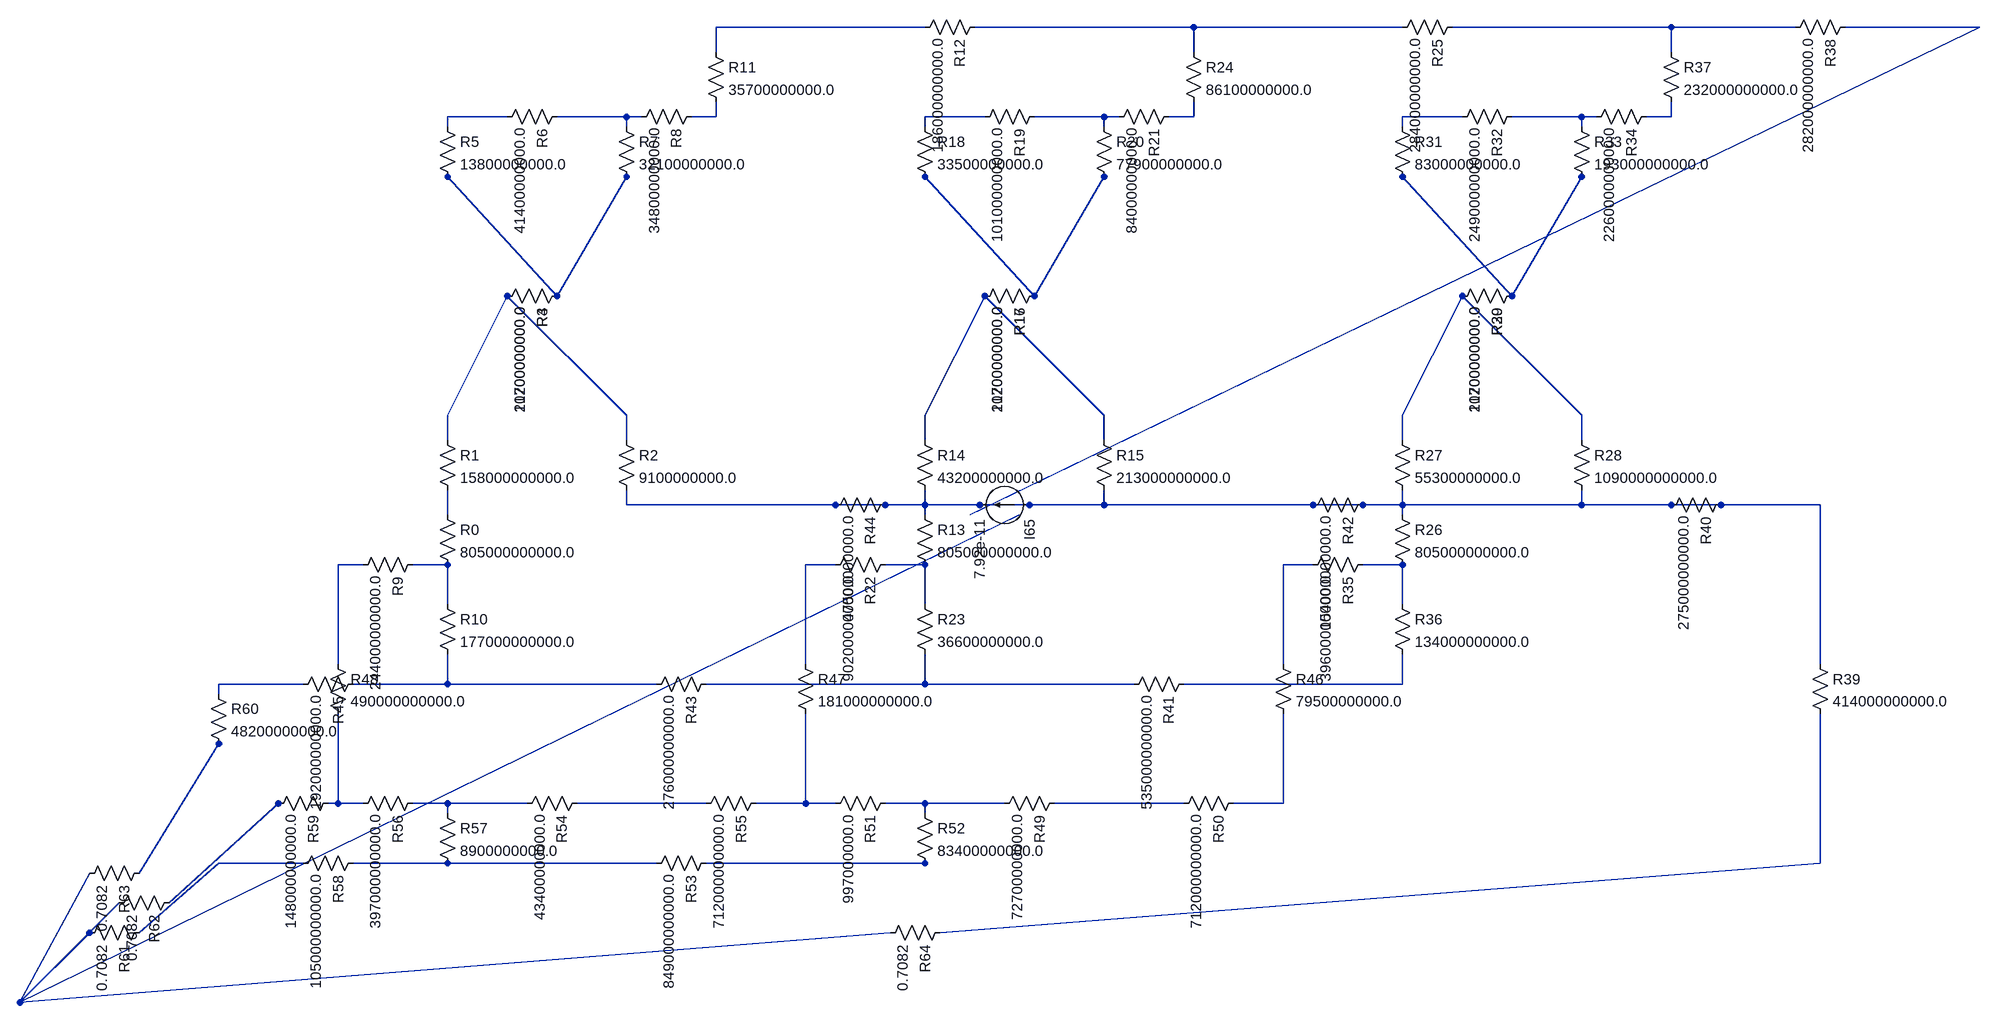
[diagram p0: schematic SPICE_layout.asc]
SPICE_layout.asc, the LTspice schematic file:
Version 4
SHEET 1 880 680
WIRE 688 -704 688 -704
WIRE 688 -784 688 -800
SYMBOL res 672 -800 R0
SYMATTR InstName R0
SYMATTR Value 805000000000.0
WIRE 688 -800 688 -824
WIRE 688 -904 688 -944
SYMBOL res 672 -920 R0
SYMATTR InstName R1
SYMATTR Value 158000000000.0
WIRE 976 -800 976 -824
WIRE 976 -904 976 -944
SYMBOL res 960 -920 R0
SYMATTR InstName R2
SYMATTR Value 9100000000.0
WIRE 688 -944 784 -1136
WIRE 864 -1136 976 -1328
SYMBOL res 880 -1152 R90
SYMATTR InstName R3
SYMATTR Value 11700000000.0
WIRE 976 -944 784 -1136
WIRE 864 -1136 688 -1328
SYMBOL res 880 -1152 R90
SYMATTR InstName R4
SYMATTR Value 20200000000.0
WIRE 688 -1328 688 -1328
WIRE 688 -1408 688 -1424
SYMBOL res 672 -1424 R0
SYMATTR InstName R5
SYMATTR Value 13800000000.0
WIRE 688 -1424 784 -1424
WIRE 864 -1424 976 -1424
SYMBOL res 880 -1440 R90
SYMATTR InstName R6
SYMATTR Value 41400000000.0
WIRE 976 -1328 976 -1328
WIRE 976 -1408 976 -1424
SYMBOL res 960 -1424 R0
SYMATTR InstName R7
SYMATTR Value 32100000000.0
WIRE 976 -1424 1000 -1424
WIRE 1080 -1424 1120 -1424
SYMBOL res 1096 -1440 R90
SYMATTR InstName R8
SYMATTR Value 34800000000.0
WIRE 512 -704 552 -704
WIRE 632 -704 688 -704
SYMBOL res 648 -720 R90
SYMATTR InstName R9
SYMATTR Value 244000000000.0
WIRE 688 -512 688 -560
WIRE 688 -640 688 -704
SYMBOL res 672 -656 R0
SYMATTR InstName R10
SYMATTR Value 177000000000.0
WIRE 1120 -1424 1120 -1448
WIRE 1120 -1528 1120 -1568
SYMBOL res 1104 -1544 R0
SYMATTR InstName R11
SYMATTR Value 35700000000.0
WIRE 1120 -1568 1456 -1568
WIRE 1536 -1568 1888 -1568
SYMBOL res 1552 -1584 R90
SYMATTR InstName R12
SYMATTR Value 186000000000.0
WIRE 1456 -704 1456 -704
WIRE 1456 -784 1456 -800
SYMBOL res 1440 -800 R0
SYMATTR InstName R13
SYMATTR Value 805000000000.0
WIRE 1456 -800 1456 -824
WIRE 1456 -904 1456 -944
SYMBOL res 1440 -920 R0
SYMATTR InstName R14
SYMATTR Value 43200000000.0
WIRE 1744 -800 1744 -824
WIRE 1744 -904 1744 -944
SYMBOL res 1728 -920 R0
SYMATTR InstName R15
SYMATTR Value 213000000000.0
WIRE 1456 -944 1552 -1136
WIRE 1632 -1136 1744 -1328
SYMBOL res 1648 -1152 R90
SYMATTR InstName R16
SYMATTR Value 11700000000.0
WIRE 1744 -944 1552 -1136
WIRE 1632 -1136 1456 -1328
SYMBOL res 1648 -1152 R90
SYMATTR InstName R17
SYMATTR Value 20200000000.0
WIRE 1456 -1328 1456 -1328
WIRE 1456 -1408 1456 -1424
SYMBOL res 1440 -1424 R0
SYMATTR InstName R18
SYMATTR Value 33500000000.0
WIRE 1456 -1424 1552 -1424
WIRE 1632 -1424 1744 -1424
SYMBOL res 1648 -1440 R90
SYMATTR InstName R19
SYMATTR Value 101000000000.0
WIRE 1744 -1328 1744 -1328
WIRE 1744 -1408 1744 -1424
SYMBOL res 1728 -1424 R0
SYMATTR InstName R20
SYMATTR Value 77900000000.0
WIRE 1744 -1424 1768 -1424
WIRE 1848 -1424 1888 -1424
SYMBOL res 1864 -1440 R90
SYMATTR InstName R21
SYMATTR Value 84000000000.0
WIRE 1264 -704 1312 -704
WIRE 1392 -704 1456 -704
SYMBOL res 1408 -720 R90
SYMATTR InstName R22
SYMATTR Value 90200000000.0
WIRE 1456 -512 1456 -560
WIRE 1456 -640 1456 -704
SYMBOL res 1440 -656 R0
SYMATTR InstName R23
SYMATTR Value 36600000000.0
WIRE 1888 -1424 1888 -1448
WIRE 1888 -1528 1888 -1568
SYMBOL res 1872 -1544 R0
SYMATTR InstName R24
SYMATTR Value 86100000000.0
WIRE 1888 -1568 2224 -1568
WIRE 2304 -1568 2656 -1568
SYMBOL res 2320 -1584 R90
SYMATTR InstName R25
SYMATTR Value 284000000000.0
WIRE 2224 -704 2224 -704
WIRE 2224 -784 2224 -800
SYMBOL res 2208 -800 R0
SYMATTR InstName R26
SYMATTR Value 805000000000.0
WIRE 2224 -800 2224 -824
WIRE 2224 -904 2224 -944
SYMBOL res 2208 -920 R0
SYMATTR InstName R27
SYMATTR Value 55300000000.0
WIRE 2512 -800 2512 -824
WIRE 2512 -904 2512 -944
SYMBOL res 2496 -920 R0
SYMATTR InstName R28
SYMATTR Value 1090000000000.0
WIRE 2224 -944 2320 -1136
WIRE 2400 -1136 2512 -1328
SYMBOL res 2416 -1152 R90
SYMATTR InstName R29
SYMATTR Value 11700000000.0
WIRE 2512 -944 2320 -1136
WIRE 2400 -1136 2224 -1328
SYMBOL res 2416 -1152 R90
SYMATTR InstName R30
SYMATTR Value 20200000000.0
WIRE 2224 -1328 2224 -1328
WIRE 2224 -1408 2224 -1424
SYMBOL res 2208 -1424 R0
SYMATTR InstName R31
SYMATTR Value 83000000000.0
WIRE 2224 -1424 2320 -1424
WIRE 2400 -1424 2512 -1424
SYMBOL res 2416 -1440 R90
SYMATTR InstName R32
SYMATTR Value 249000000000.0
WIRE 2512 -1328 2512 -1328
WIRE 2512 -1408 2512 -1424
SYMBOL res 2496 -1424 R0
SYMATTR InstName R33
SYMATTR Value 193000000000.0
WIRE 2512 -1424 2536 -1424
WIRE 2616 -1424 2656 -1424
SYMBOL res 2632 -1440 R90
SYMATTR InstName R34
SYMATTR Value 226000000000.0
WIRE 2032 -704 2080 -704
WIRE 2160 -704 2224 -704
SYMBOL res 2176 -720 R90
SYMATTR InstName R35
SYMATTR Value 39600000000.0
WIRE 2224 -512 2224 -560
WIRE 2224 -640 2224 -704
SYMBOL res 2208 -656 R0
SYMATTR InstName R36
SYMATTR Value 134000000000.0
WIRE 2656 -1424 2656 -1448
WIRE 2656 -1528 2656 -1568
SYMBOL res 2640 -1544 R0
SYMATTR InstName R37
SYMATTR Value 232000000000.0
WIRE 2656 -1568 2856 -1568
WIRE 2936 -1568 3152 -1568
SYMBOL res 2952 -1584 R90
SYMATTR InstName R38
SYMATTR Value 282000000000.0
WIRE 2896 -224 2896 -464
WIRE 2896 -544 2896 -800
SYMBOL res 2880 -560 R0
SYMATTR InstName R39
SYMATTR Value 414000000000.0
WIRE 2896 -800 2656 -800
WIRE 2736 -800 2512 -800
SYMBOL res 2752 -816 R90
SYMATTR InstName R40
SYMATTR Value 275000000000.0
WIRE 1456 -512 1792 -512
WIRE 1872 -512 2224 -512
SYMBOL res 1888 -528 R90
SYMATTR InstName R41
SYMATTR Value 535000000000.0
WIRE 2512 -800 2080 -800
WIRE 2160 -800 1744 -800
SYMBOL res 2176 -816 R90
SYMATTR InstName R42
SYMATTR Value 154000000000.0
WIRE 688 -512 1024 -512
WIRE 1104 -512 1456 -512
SYMBOL res 1120 -528 R90
SYMATTR InstName R43
SYMATTR Value 276000000000.0
WIRE 1744 -800 1312 -800
WIRE 1392 -800 976 -800
SYMBOL res 1408 -816 R90
SYMATTR InstName R44
SYMATTR Value 47500000000.0
WIRE 320 -512 456 -512
WIRE 536 -512 688 -512
SYMBOL res 552 -528 R90
SYMATTR InstName R45
SYMATTR Value 192000000000.0
WIRE 2032 -320 2032 -464
WIRE 2032 -544 2032 -704
SYMBOL res 2016 -560 R0
SYMATTR InstName R46
SYMATTR Value 79500000000.0
WIRE 1264 -320 1264 -464
WIRE 1264 -544 1264 -704
SYMBOL res 1248 -560 R0
SYMATTR InstName R47
SYMATTR Value 181000000000.0
WIRE 512 -320 512 -464
WIRE 512 -544 512 -704
SYMBOL res 496 -560 R0
SYMATTR InstName R48
SYMATTR Value 490000000000.0
WIRE 1456 -320 1584 -320
WIRE 1664 -320 1808 -320
SYMBOL res 1680 -336 R90
SYMATTR InstName R49
SYMATTR Value 72700000000.0
WIRE 1808 -320 1872 -320
WIRE 1952 -320 2032 -320
SYMBOL res 1968 -336 R90
SYMATTR InstName R50
SYMATTR Value 712000000000.0
WIRE 1264 -320 1312 -320
WIRE 1392 -320 1456 -320
SYMBOL res 1408 -336 R90
SYMATTR InstName R51
SYMATTR Value 997000000.0
WIRE 1456 -224 1456 -224
WIRE 1456 -304 1456 -320
SYMBOL res 1440 -320 R0
SYMATTR InstName R52
SYMATTR Value 83400000000.0
WIRE 688 -224 1024 -224
WIRE 1104 -224 1456 -224
SYMBOL res 1120 -240 R90
SYMATTR InstName R53
SYMATTR Value 849000000000.0
WIRE 688 -320 816 -320
WIRE 896 -320 1040 -320
SYMBOL res 912 -336 R90
SYMATTR InstName R54
SYMATTR Value 43400000000.0
WIRE 1040 -320 1104 -320
WIRE 1184 -320 1264 -320
SYMBOL res 1200 -336 R90
SYMATTR InstName R55
SYMATTR Value 712000000000.0
WIRE 512 -320 552 -320
WIRE 632 -320 688 -320
SYMBOL res 648 -336 R90
SYMATTR InstName R56
SYMATTR Value 397000000000.0
WIRE 688 -224 688 -224
WIRE 688 -304 688 -320
SYMBOL res 672 -320 R0
SYMATTR InstName R57
SYMATTR Value 8900000000.0
WIRE 320 -224 456 -224
WIRE 536 -224 688 -224
SYMBOL res 552 -240 R90
SYMATTR InstName R58
SYMATTR Value 105000000000.0
WIRE 416 -320 416 -320
WIRE 496 -320 512 -320
SYMBOL res 512 -336 R90
SYMATTR InstName R59
SYMATTR Value 148000000000.0
WIRE 320 -416 320 -416
WIRE 320 -496 320 -512
SYMBOL res 304 -512 R0
SYMATTR InstName R60
SYMATTR Value 48200000000.0
WIRE 0 0 112 -112
WIRE 192 -112 320 -224
SYMBOL res 208 -128 R90
SYMATTR InstName R61
SYMATTR Value 0.7082
WIRE 0 0 160 -160
WIRE 240 -160 416 -320
SYMBOL res 256 -176 R90
SYMATTR InstName R62
SYMATTR Value 0.7082
WIRE 0 0 112 -208
WIRE 192 -208 320 -416
SYMBOL res 208 -224 R90
SYMATTR InstName R63
SYMATTR Value 0.7082
WIRE 0 0 1400 -112
WIRE 1480 -112 2896 -224
SYMBOL res 1496 -128 R90
SYMATTR InstName R64
SYMATTR Value 0.7082
WIRE 3152 -1568 1528 -784
WIRE 1608 -784 0 0
SYMBOL current 1624 -800 R90
SYMATTR InstName I65
SYMATTR Value 7.92e-11
SYMBOL GND 0.0 0.0 R0

The netlist it stands for:
* SPICE_layout.asc
R0 N002 N001 805000000000.0
R1 N003 N002 158000000000.0
R2 N003 N004 9100000000.0
R3 N005 N003 11700000000.0
R4 N005 N003 20200000000.0
R5 N006 N005 13800000000.0
R6 N007 N006 41400000000.0
R7 N007 N005 32100000000.0
R8 N008 N007 34800000000.0
R9 N001 N009 244000000000.0
R10 N001 N010 177000000000.0
R11 N011 N008 35700000000.0
R12 N012 N011 186000000000.0
R13 N004 N013 805000000000.0
R14 N014 N004 43200000000.0
R15 N014 N004 213000000000.0
R16 N015 N014 11700000000.0
R17 N015 N014 20200000000.0
R18 N016 N015 33500000000.0
R19 N017 N016 101000000000.0
R20 N017 N015 77900000000.0
R21 N018 N017 84000000000.0
R22 N013 N019 90200000000.0
R23 N013 N020 36600000000.0
R24 N012 N018 86100000000.0
R25 N021 N012 284000000000.0
R26 N004 N022 805000000000.0
R27 N023 N004 55300000000.0
R28 N023 N004 1090000000000.0
R29 N024 N023 11700000000.0
R30 N024 N023 20200000000.0
R31 N025 N024 83000000000.0
R32 N026 N025 249000000000.0
R33 N026 N024 193000000000.0
R34 N027 N026 226000000000.0
R35 N022 N028 39600000000.0
R36 N022 N029 134000000000.0
R37 N021 N027 232000000000.0
R38 N030 N021 282000000000.0
R39 N004 N031 414000000000.0
R40 N004 N004 275000000000.0
R41 N029 N020 535000000000.0
R42 N004 N004 154000000000.0
R43 N020 N010 276000000000.0
R44 N004 N004 47500000000.0
R45 N010 N032 192000000000.0
R46 N028 N033 79500000000.0
R47 N019 N034 181000000000.0
R48 N009 N035 490000000000.0
R49 N037 N036 72700000000.0
R50 N033 N037 712000000000.0
R51 N036 N034 997000000.0
R52 N036 N038 83400000000.0
R53 N038 N039 849000000000.0
R54 N041 N040 43400000000.0
R55 N034 N041 712000000000.0
R56 N040 N035 397000000000.0
R57 N040 N039 8900000000.0
R58 N039 N042 105000000000.0
R59 N035 N043 148000000000.0
R60 N032 N044 48200000000.0
R61 N042 N045 0.7082
R62 N043 N045 0.7082
R63 N044 N045 0.7082
R64 N031 N045 0.7082
I65 N004 N004 7.92e-11
.backanno
.end